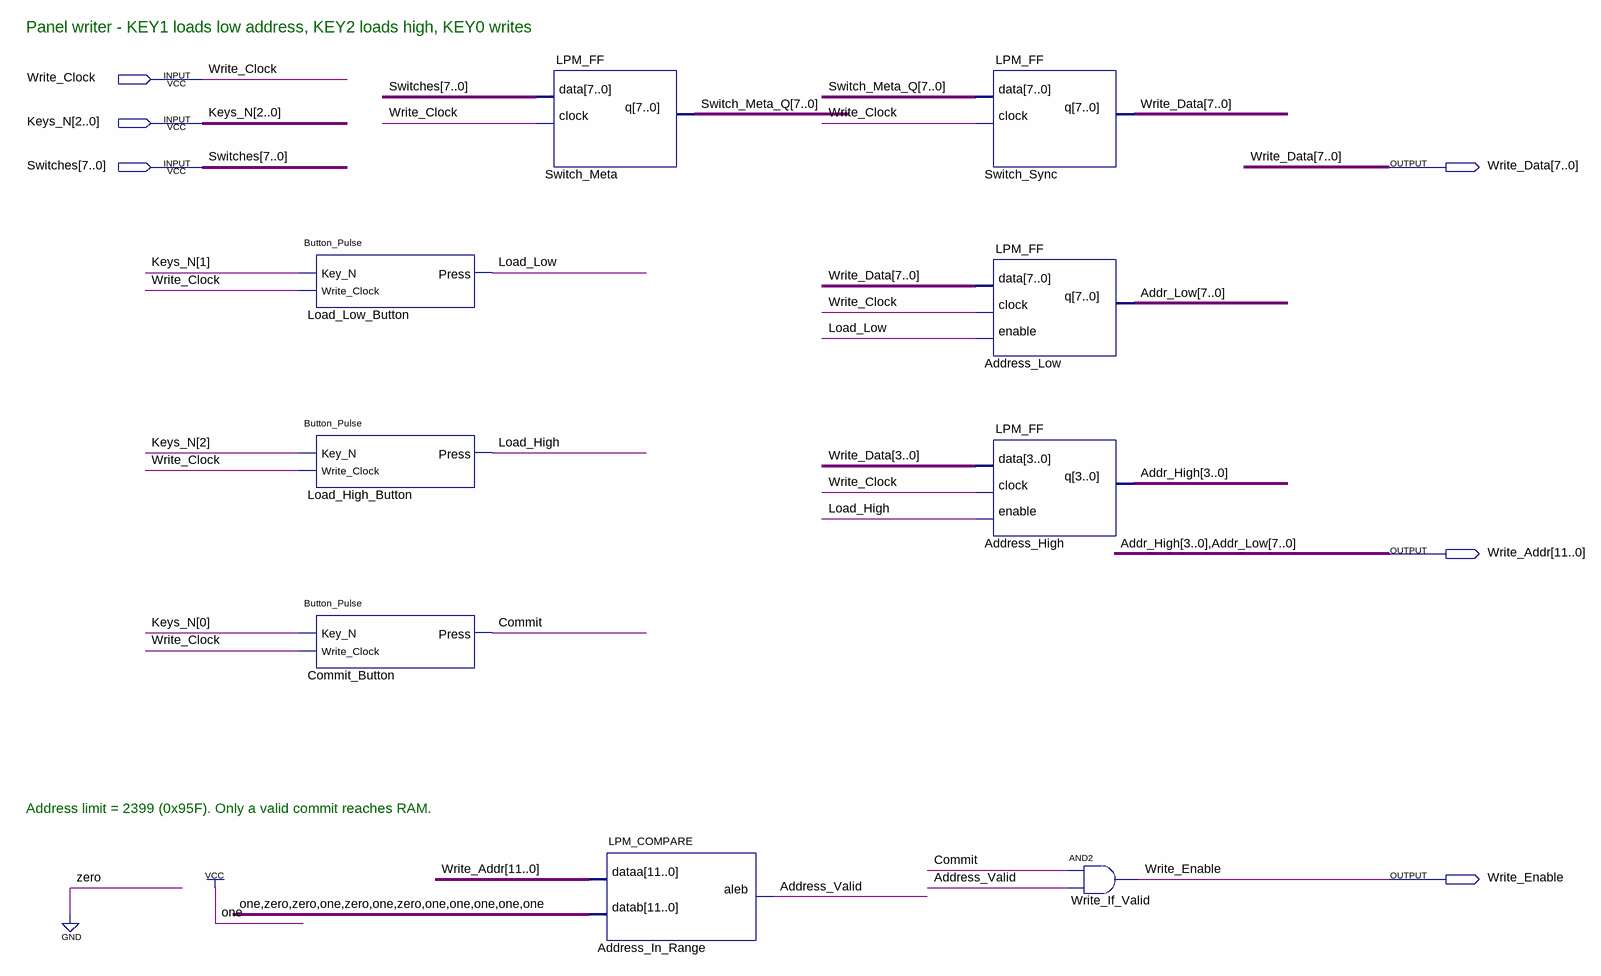
[diagram p0: schematic sheet]
// Quartus schematic Panel_Write.bdf as structural Verilog: 9 symbols, 6 pins
module Panel_Write (
  input  Write_Clock,
  input  [2:0] Keys_N,
  input  [7:0] Switches,
  output [7:0] Write_Data,
  output [11:0] Write_Addr,
  output Write_Enable
);

  wire Address_Valid, Commit, Load_High, Load_Low;
  wire [7:0] Switch_Meta_Q;

  Button_Pulse Load_Low_Button (.Key_N(Keys_N[1]), .Write_Clock(Write_Clock), .Press(Load_Low));
  Button_Pulse Load_High_Button (.Key_N(Keys_N[2]), .Write_Clock(Write_Clock), .Press(Load_High));
  Button_Pulse Commit_Button (.Key_N(Keys_N[0]), .Write_Clock(Write_Clock), .Press(Commit));
  LPM_FF #(.LPM_WIDTH(8), .LPM_FFTYPE("DFF")) Switch_Meta (.data(Switches), .clock(Write_Clock), .q(Switch_Meta_Q));
  LPM_COMPARE #(.LPM_WIDTH(12), .LPM_REPRESENTATION("UNSIGNED")) Address_In_Range (
    .dataa(Write_Addr), .datab(12'b100101011111), .aleb(Address_Valid));
  LPM_FF #(.LPM_WIDTH(8), .LPM_FFTYPE("DFF")) Switch_Sync (.data(Switch_Meta_Q), .clock(Write_Clock), .q(Write_Data));
  LPM_FF #(.LPM_WIDTH(8), .LPM_FFTYPE("DFF")) Address_Low (
    .data(Write_Data), .clock(Write_Clock), .enable(Load_Low), .q(Write_Addr[7:0]));
  LPM_FF #(.LPM_WIDTH(4), .LPM_FFTYPE("DFF")) Address_High (
    .data(Write_Data[3:0]), .clock(Write_Clock), .enable(Load_High), .q(Write_Addr[11:8]));
  and Write_If_Valid (Write_Enable, Commit, Address_Valid);

  // Other names for the same wires on the sheet: Addr_High[3:0] = Write_Addr[11:8]; Addr_Low[7:0] = Write_Addr[7:0]

  // Notes on the sheet:
  //   Panel writer - KEY1 loads low address, KEY2 loads high, KEY0 writes
  //   Address limit = 2399 (0x95F). Only a valid commit reaches RAM.
endmodule
